# Altium schematic sheet power_supply.SchDoc
size A3; SheetNumber: 1; SheetTotal: 19; SPICEModelCacheCEUNFSJS: <root> / <DocumentId>CEUNFSJS</DocumentId> / </root>
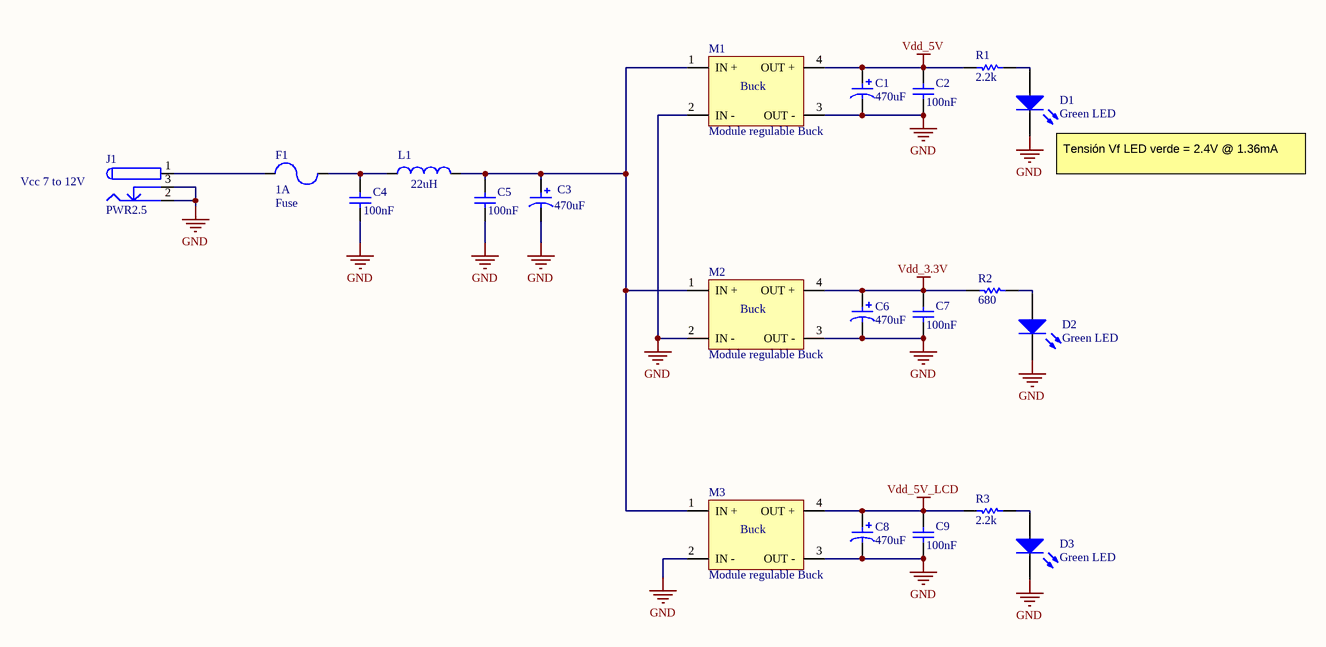
[diagram p0: power_supply.SchDoc]

## Parts
C1  value 470uF  [electrolytic 470uF/25V]  (hidden comment: Electrolytic capacitor)
C2  value 100nF  [capacitor 0805]  (hidden comment: ceramic capacitor)
C3  value 470uF  [electrolytic 470uF/25V]  (hidden comment: Electrolytic capacitor)
C4  value 100nF  [capacitor 0805]  (hidden comment: ceramic capacitor)
C5  value 100nF  [capacitor 0805]  (hidden comment: ceramic capacitor)
C6  value 470uF  [electrolytic 470uF/25V]  (hidden comment: Electrolytic capacitor)
C7  value 100nF  [capacitor 0805]  (hidden comment: ceramic capacitor)
C8  value 470uF  [electrolytic 470uF/25V]  (hidden comment: Electrolytic capacitor)
C9  value 100nF  [capacitor 0805]  (hidden comment: ceramic capacitor)
D1  Green LED  [led 0603 clear]
D2  Green LED  [led 0603 clear]
D3  Green LED  [led 0603 clear]
F1  Fuse  value 1A  [Fuse]
J1  PWR2.5  [female connector DC-005]
L1  value 22uH  [ferrite inductor 22uH]  (hidden comment: Inductor)
M1  Module regulable Buck  [module step down MP1584]
M2  Module regulable Buck  [module step down MP1584]
M3  Module regulable Buck  [module step down MP1584]
R1  value 2.2k  [resistor 0603]  (hidden comment: resistor)
R2  value 680  [resistor 0603]  (hidden comment: resistor)
R3  value 2.2k  [resistor 0603]  (hidden comment: resistor)

## Nets
GND: C1.2 C2.2 C3.2 C4.2 C5.2 C6.2 C7.2 C8.2 C9.2 D1.2(K) D2.2(K) D3.2(K) J1.2 J1.3 M1.2(IN_-) M1.3(OUT_-) M2.2(IN_-) M2.3(OUT_-) M3.2(IN_-) M3.3(OUT_-)
Vdd_3.3V: C6.1 C7.1 M2.4(OUT_+) R2.2
Vdd_5V: C1.1 C2.1 M1.4(OUT_+) R1.2
Vdd_5V_LCD: C8.1 C9.1 M3.4(OUT_+) R3.2
NetC3_1: C3.1 C5.1 L1.2 M1.1(IN_+) M2.1(IN_+) M3.1(IN_+)
NetC4_1: C4.1 F1.2 L1.1
NetD1_1: D1.1(A) R1.1
NetD2_1: D2.1(A) R2.1
NetD3_1: D3.1(A) R3.1
NetF1_1: F1.1 J1.1

## Notes on the sheet
- Vcc 7 to 12V
- (near D1) Tensión Vf LED verde = 2.4V @ 1.36mA
- (in symbol Module regulable Step Down converter) Buck

## Library data of the parts
C2 C4 C5 C7 C9 = ceramic capacitor: Multilayer ceramic capacitor; V: 50; LCSC part: C1711; Package: 0805
D1-D3 = LED2: Green LED 0603; Package: 0603
J1 = PWR2.5: Low Voltage Power Supply Connector; Publisher: Altium Limited
M1-M3 = Module regulable Step Down converter: pin to pad: 1>2 2>1 3>4 4>3
R1-R3 = resistor: Package: 0603